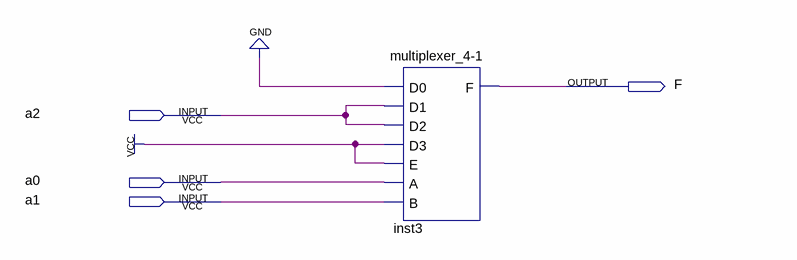
[diagram p0: schematic sheet]
// Quartus schematic 3args.bdf as structural Verilog: 1 symbols, 4 pins
module \3args  (
  input  a2,
  input  a0,
  input  a1,
  output F
);

  \multiplexer_4-1  inst3 (.D0(1'b0), .D1(a2), .D2(a2), .D3(1'b1), .E(1'b1), .A(a0), .B(a1), .F(F));
endmodule
